# Altium schematic sheet net_label_backslash.SchDoc
size 254 x 203 mm
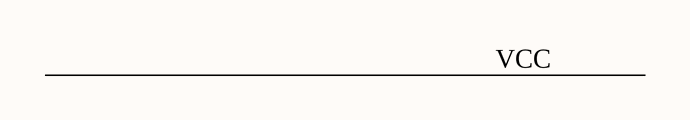
[diagram p0: net_label_backslash.SchDoc]